# EAGLE design mbc_92_24_07_20 (EAGLE 7.6.0)

## Sheet 1 of 2
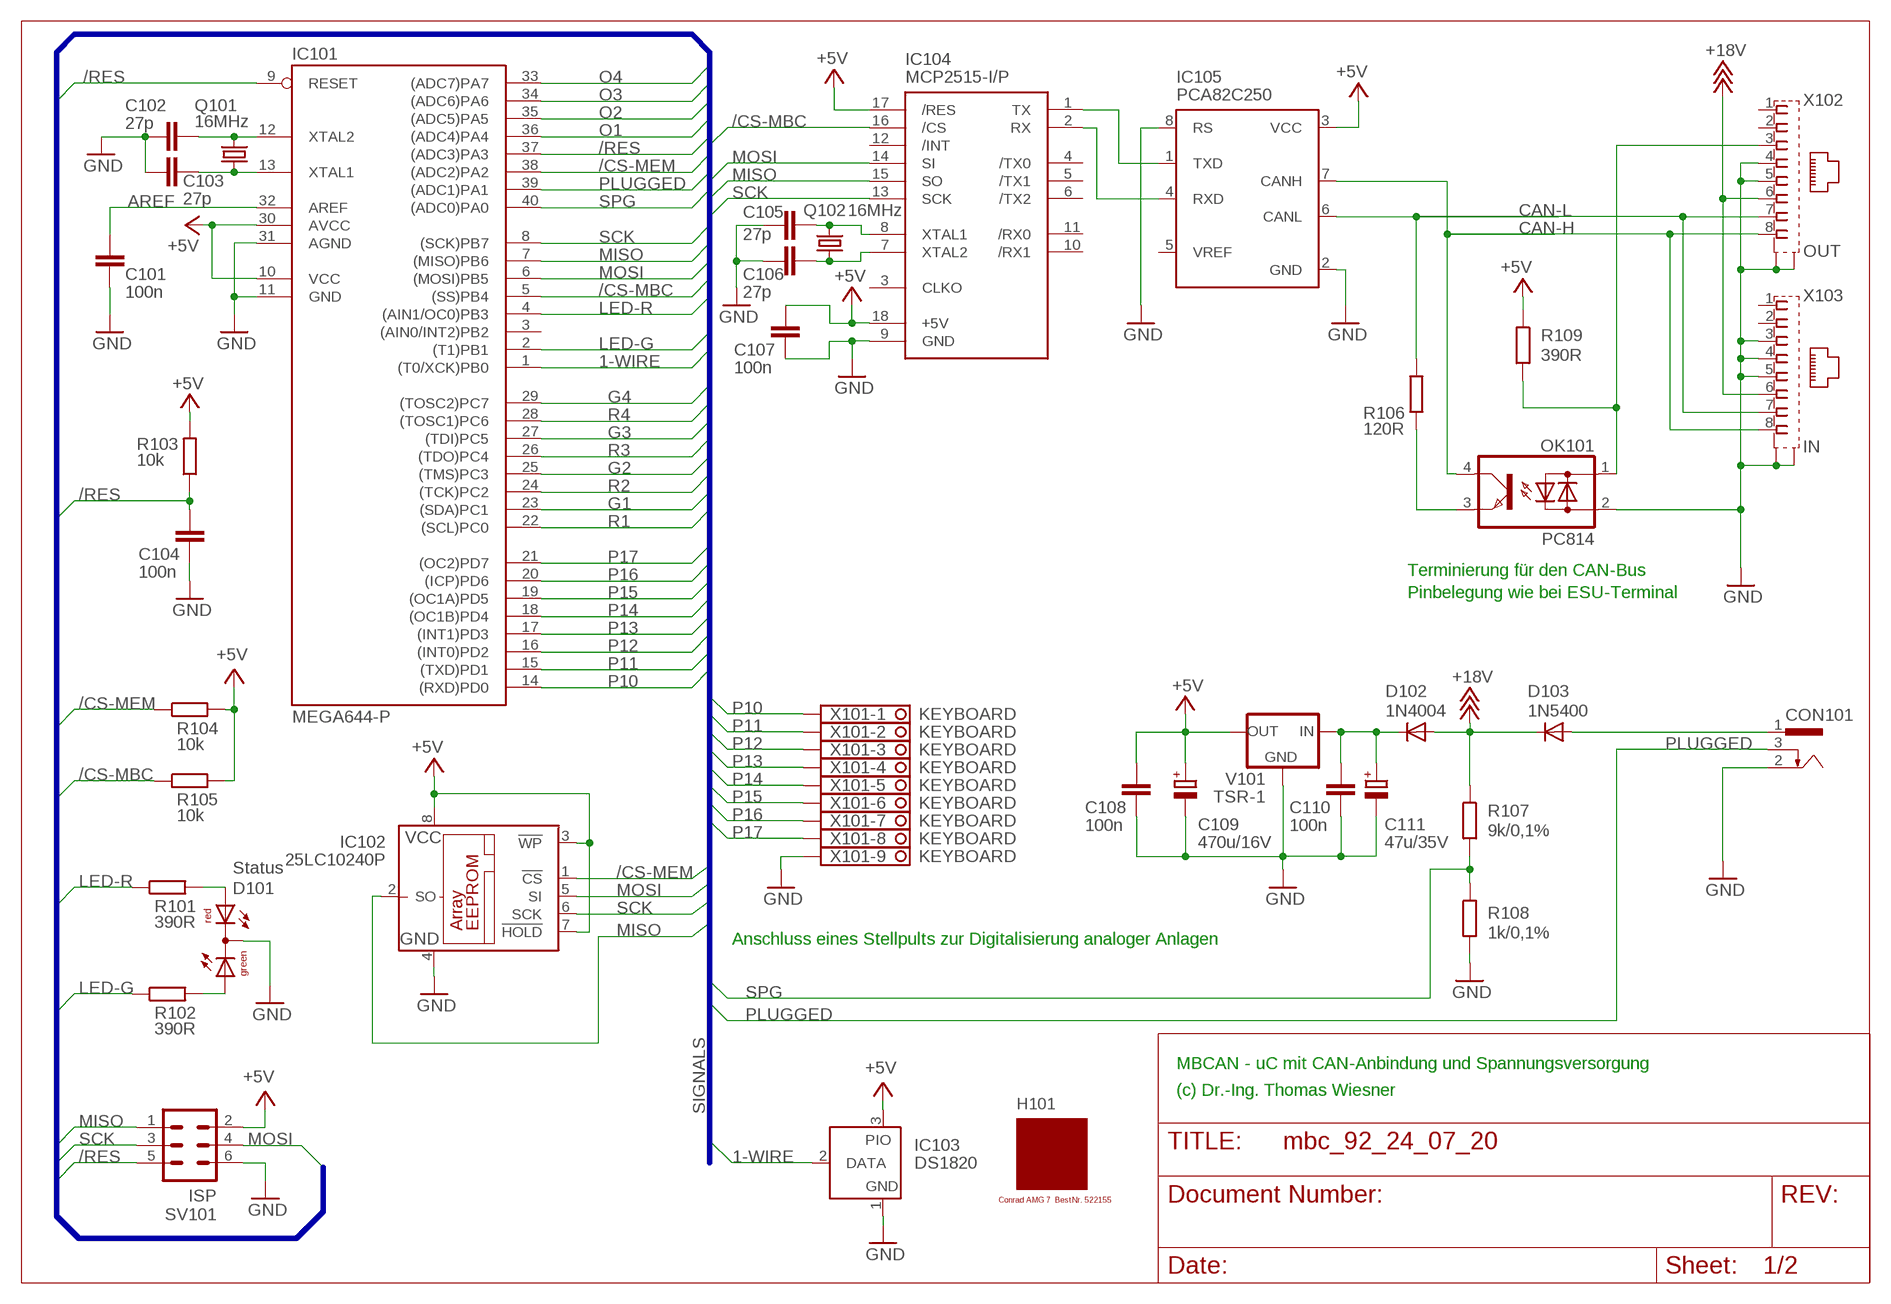
[diagram p0: schematic, sheet 1]

### Parts
C101  100n  C-EU025-025X050  [C025-025X050]
C102  27p  C-EU025-025X050  [C025-025X050]
C103  27p  C-EU025-025X050  [C025-025X050]
C104  100n  C-EU025-025X050  [C025-025X050]
C105  27p  C-EU025-025X050  [C025-025X050]
C106  27p  C-EU025-025X050  [C025-025X050]
C107  100n  C-EU025-025X050  [C025-025X050]
C108  100n  C-EU025-025X050  [C025-025X050]
C109  470u/16V  CPOL-EUE3.5-8  [E3,5-8]
C110  100n  C-EU025-025X050  [C025-025X050]
C111  47u/35V  CPOL-EUE2.5-7  [E2,5-7]
CON101  POWER-JACK  [POWER-JACK]
D101  Status  DUOLED5MM  [DUOLED5MM]
D102  1N4004  [DO41-10]
D103  1N5400  [DO201-15]
H101  MODULGEHÄUSE-AMG-7  [MODULGEHÄUSE-1]
IC101  MEGA644-P  MEGA323-P  [DIL40]
IC102  25LC10240P  25LC040P  [DIL8]
IC103  DS1820  DS2405  [TO92-]
IC104  MCP2515-I/P  MCP2510-I/P  [DIL18]
IC105  PCA82C250  [DIL08]
OK101  PC814  [DIL04]
Q101  16MHz  CRYSTALHC49U70  [HC49U70]
Q102  16MHz  CRYSTALHC49U70  [HC49U70]
R101  390R  R-EU_0207/10  [0207/10]
R102  390R  R-EU_0207/10  [0207/10]
R103  10k  R-EU_0207/10  [0207/10]
R104  10k  R-EU_0207/10  [0207/10]
R105  10k  R-EU_0207/10  [0207/10]
R106  120R  R-EU_0207/10  [0207/10]
R107  9k/0,1%  R-EU_0207/10  [0207/10]
R108  1k/0,1%  R-EU_0207/10  [0207/10]
R109  390R  R-EU_0207/10  [0207/10]
SV101  ISP  ML6  [ML6]
V101  TSR-1  [TRACO-TSR-1]
X101  KEYBOARD  1751316  [1751316]
X102  OUT  0446200002  [0446200002]
X103  IN  0446200002  [0446200002]

### Nets
1-WIRE: IC101.1((T0/XCK)PB0) IC103.2(DATA)
+5V: C107.1 C108.1 C109.+ IC101.10(VCC) IC101.30(AVCC) IC102.3(!WP) IC102.7(!HOLD) IC102.8(VCC) IC103.3(PIO) IC104.17(/RES) IC104.18(+5V) IC105.3(VCC) R103.2 R104.2 R105.2 R109.1 SV101.2 V101.OUT ; also sheet 2
+18V: D102.A D103.C R107.1 X102.6 X103.6
/CS-MBC: IC101.5((SS)PB4) IC104.16(/CS) R105.1
/CS-MEM: IC101.38((ADC2)PA2) IC102.1(!CS) R104.1
/RES: C104.1 IC101.9(RESET) IC101.37((ADC3)PA3) R103.1 SV101.5
AREF: C101.1 IC101.32(AREF)
CAN-H: IC105.7(CANH) OK101.4(C) X102.8 X103.8
CAN-L: IC105.6(CANL) R106.2 X102.7 X103.7
G1: IC101.23((SDA)PC1) ; also sheet 2
G2: IC101.25((TMS)PC3) ; also sheet 2
G3: IC101.27((TDI)PC5) ; also sheet 2
G4: IC101.29((TOSC2)PC7) ; also sheet 2
GND: C101.2 C102.1 C103.1 C104.2 C105.1 C106.1 C107.2 C108.2 C109.- C110.2 C111.- CON101.2 D101.K(C) IC101.11(GND) IC101.31(AGND) IC102.4(GND) IC103.1(GND) IC104.9(GND) IC105.2(GND) IC105.8(RS) OK101.2(AC2) R108.2 SV101.6 V101.GND X101.9 X102.4 X102.5 X102.S@1(S1) X102.S@2(S2) X103.3 X103.4 X103.5 X103.S@1(S1) X103.S@2(S2) ; also sheet 2
LED-G: IC101.2((T1)PB1) R102.1
LED-R: IC101.4((AIN1/OC0)PB3) R101.1
MISO: IC101.7((MISO)PB6) IC102.2(SO) IC104.15(SO) SV101.1
MOSI: IC101.6((MOSI)PB5) IC102.5(SI) IC104.14(SI) SV101.4
N$1: IC104.1(TX) IC105.1(TXD)
N$2: IC104.2(RX) IC105.4(RXD)
N$3: OK101.3(E) R106.1
N$4: OK101.1(AC1) R109.2 X102.3
N$6: C110.1 C111.+ D102.C V101.IN
N$9: D101.AR R101.2
N$13: D101.AG R102.2
N$40: C102.2 IC101.12(XTAL2) Q101.2
N$41: C103.2 IC101.13(XTAL1) Q101.1
N$42: C105.2 IC104.8(XTAL1) Q102.2
N$43: C106.2 IC104.7(XTAL2) Q102.1
O1: IC101.36((ADC4)PA4) ; also sheet 2
O2: IC101.35((ADC5)PA5) ; also sheet 2
O3: IC101.34((ADC6)PA6) ; also sheet 2
O4: IC101.33((ADC7)PA7) ; also sheet 2
P10: IC101.14((RXD)PD0) X101.1
P11: IC101.15((TXD)PD1) X101.2
P12: IC101.16((INT0)PD2) X101.3
P13: IC101.17((INT1)PD3) X101.4
P14: IC101.18((OC1B)PD4) X101.5
P15: IC101.19((OC1A)PD5) X101.6
P16: IC101.20((ICP)PD6) X101.7
P17: IC101.21((OC2)PD7) X101.8
PLUGGED: CON101.3 IC101.39((ADC1)PA1)
R1: IC101.22((SCL)PC0) ; also sheet 2
R2: IC101.24((TCK)PC2) ; also sheet 2
R3: IC101.26((TDO)PC4) ; also sheet 2
R4: IC101.28((TOSC1)PC6) ; also sheet 2
SCK: IC101.8((SCK)PB7) IC102.6(SCK) IC104.13(SCK) SV101.3
SPG: IC101.40((ADC0)PA0) R107.2 R108.1
V-NETZTEIL1: CON101.1 D103.A
Unconnected: IC101.3((AIN0/INT2)PB2) IC104.3(CLKO) IC104.4(/TX0) IC104.5(/TX1) IC104.6(/TX2) IC104.10(/RX1) IC104.11(/RX0) IC104.12(/INT) IC105.5(VREF) X102.1 X102.2 X103.1 X103.2

### Buses
SIGNALS

### Notes on the sheet
- Terminierung für den CAN-Bus
- Pinbelegung wie bei ESU-Terminal
- Anschluss eines Stellpults zur Digitalisierung analoger Anlagen
- MBCAN - uC mit CAN-Anbindung und Spannungsversorgung
- (c) Dr.-Ing. Thomas Wiesner

## Sheet 2 of 2
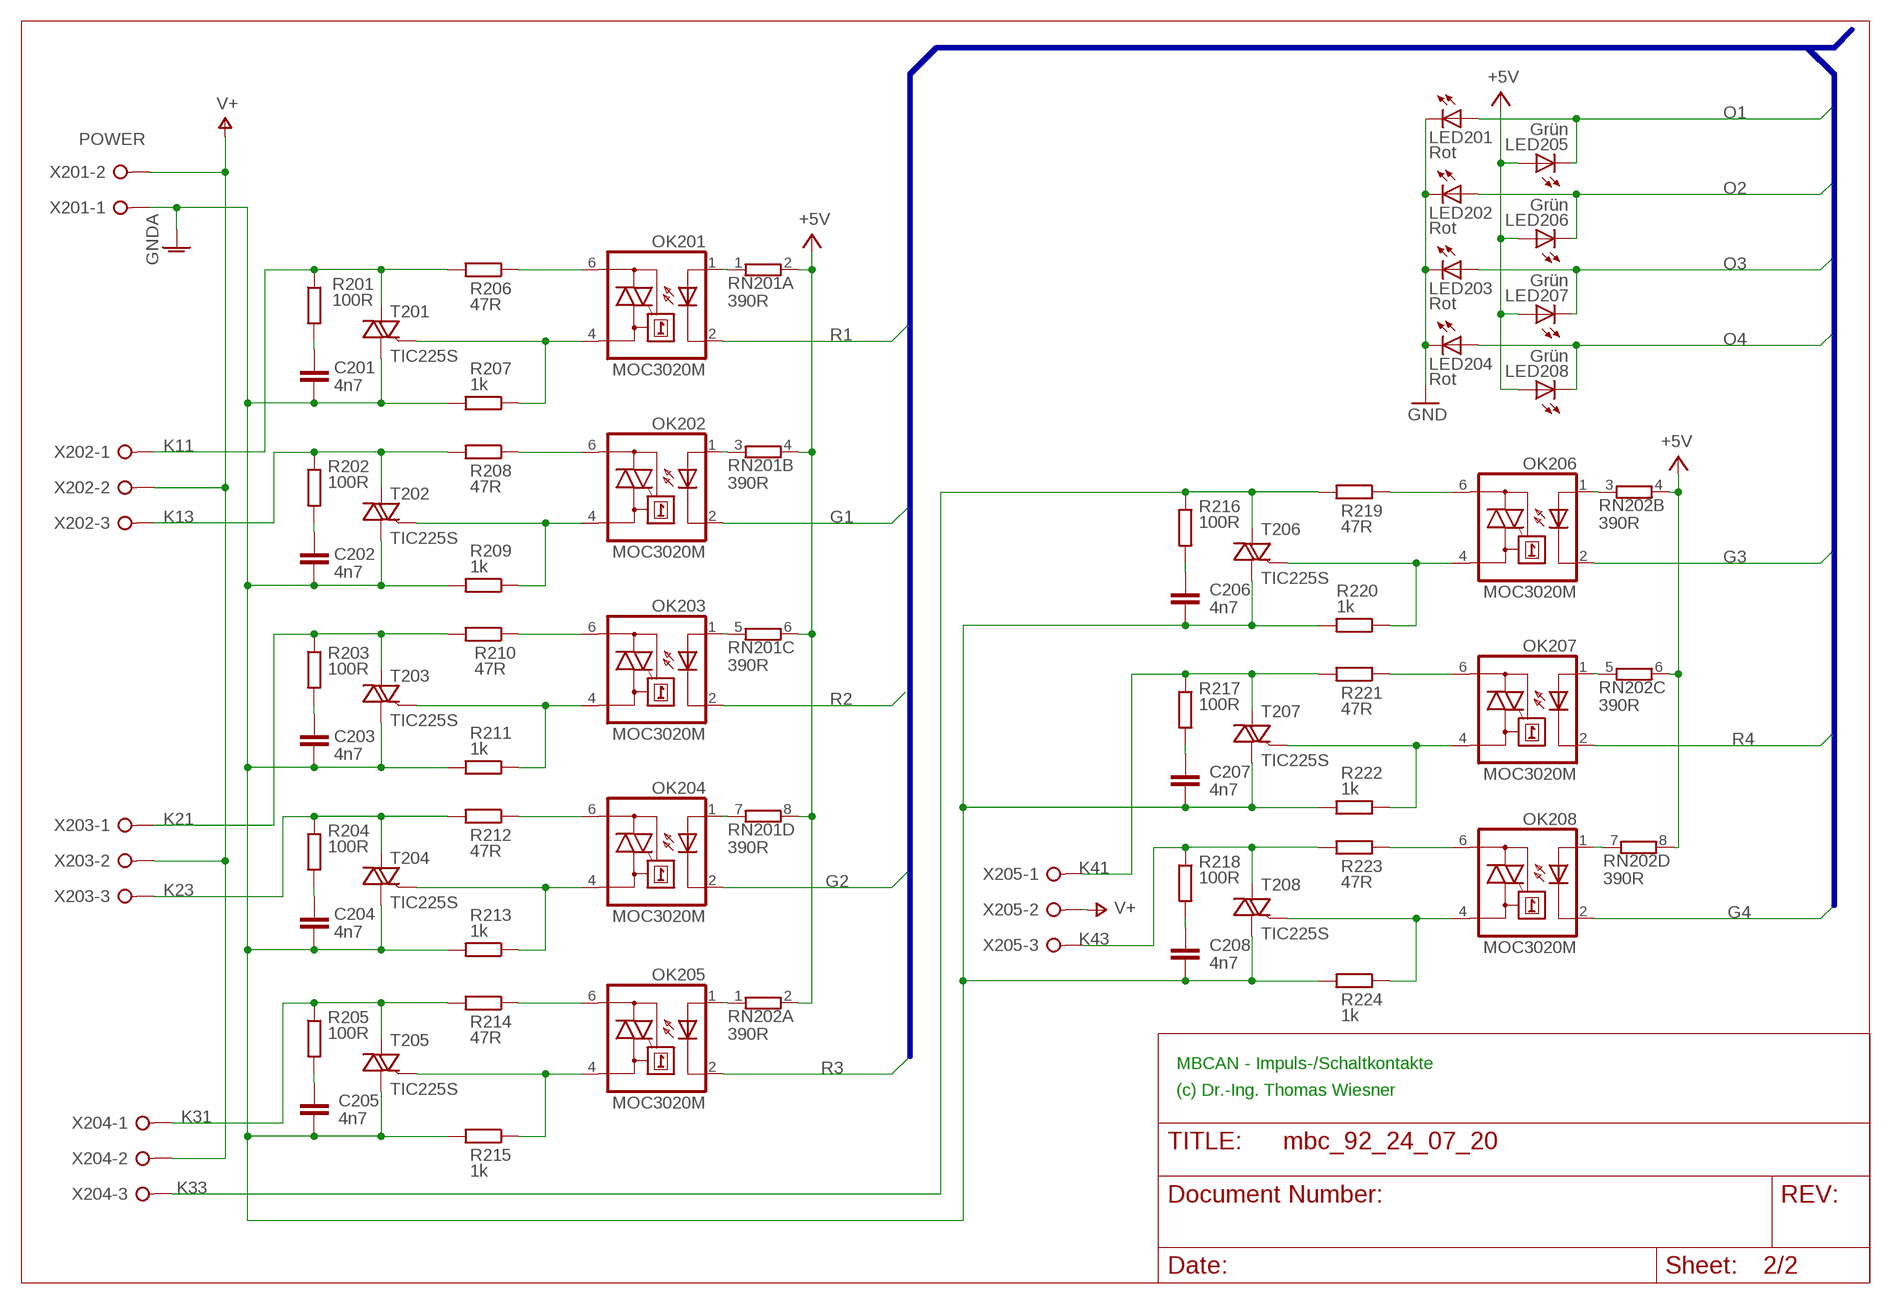
[diagram p1: schematic, sheet 2]

### Parts
C201  4n7  C-EU025-025X050  [C025-025X050]
C202  4n7  C-EU025-025X050  [C025-025X050]
C203  4n7  C-EU025-025X050  [C025-025X050]
C204  4n7  C-EU025-025X050  [C025-025X050]
C205  4n7  C-EU025-025X050  [C025-025X050]
C206  4n7  C-EU025-025X050  [C025-025X050]
C207  4n7  C-EU025-025X050  [C025-025X050]
C208  4n7  C-EU025-025X050  [C025-025X050]
LED201  Rot  LED3MM  [LED3MM]
LED202  Rot  LED3MM  [LED3MM]
LED203  Rot  LED3MM  [LED3MM]
LED204  Rot  LED3MM  [LED3MM]
LED205  Grün  LED3MM  [LED3MM]
LED206  Grün  LED3MM  [LED3MM]
LED207  Grün  LED3MM  [LED3MM]
LED208  Grün  LED3MM  [LED3MM]
OK201  MOC3020M  [DIL06]
OK202  MOC3020M  [DIL06]
OK203  MOC3020M  [DIL06]
OK204  MOC3020M  [DIL06]
OK205  MOC3020M  [DIL06]
OK206  MOC3020M  [DIL06]
OK207  MOC3020M  [DIL06]
OK208  MOC3020M  [DIL06]
R201  100R  R-EU_0207/10  [0207/10]
R202  100R  R-EU_0207/10  [0207/10]
R203  100R  R-EU_0207/10  [0207/10]
R204  100R  R-EU_0207/10  [0207/10]
R205  100R  R-EU_0207/10  [0207/10]
R206  47R  R-EU_0207/10  [0207/10]
R207  1k  R-EU_0207/10  [0207/10]
R208  47R  R-EU_0207/10  [0207/10]
R209  1k  R-EU_0207/10  [0207/10]
R210  47R  R-EU_0207/10  [0207/10]
R211  1k  R-EU_0207/10  [0207/10]
R212  47R  R-EU_0207/10  [0207/10]
R213  1k  R-EU_0207/10  [0207/10]
R214  47R  R-EU_0207/10  [0207/10]
R215  1k  R-EU_0207/10  [0207/10]
R216  100R  R-EU_0207/10  [0207/10]
R217  100R  R-EU_0207/10  [0207/10]
R218  100R  R-EU_0207/10  [0207/10]
R219  47R  R-EU_0207/10  [0207/10]
R220  1k  R-EU_0207/10  [0207/10]
R221  47R  R-EU_0207/10  [0207/10]
R222  1k  R-EU_0207/10  [0207/10]
R223  47R  R-EU_0207/10  [0207/10]
R224  1k  R-EU_0207/10  [0207/10]
RN201  390R  E4R  [SIL8]
RN202  390R  E4R  [SIL8]
T201  TIC225S  [TO220DS]
T202  TIC225S  [TO220DS]
T203  TIC225S  [TO220DS]
T204  TIC225S  [TO220DS]
T205  TIC225S  [TO220DS]
T206  TIC225S  [TO220DS]
T207  TIC225S  [TO220DS]
T208  TIC225S  [TO220DS]
X201  POWER  W237-02P  [W237-132]
X202  W237-03P  [W237-133]
X203  W237-03P  [W237-133]
X204  W237-03P  [W237-133]
X205  W237-03P  [W237-133]

### Nets
+5V: LED205.A LED206.A LED207.A LED208.A RN201.2 RN201.4 RN201.6 RN201.8 RN202.2 RN202.4 RN202.6 RN202.8 ; also sheet 1
G1: OK202.2(C) ; also sheet 1
G2: OK204.2(C) ; also sheet 1
G3: OK206.2(C) ; also sheet 1
G4: OK208.2(C) ; also sheet 1
GND: LED201.K(C) LED202.K(C) LED203.K(C) LED204.K(C) ; also sheet 1
GNDA: C201.2 C202.2 C203.2 C204.2 C205.2 C206.2 C207.2 C208.2 R207.2 R209.2 R211.2 R213.2 R215.2 R220.2 R222.2 R224.2 T201.A1 T202.A1 T203.A1 T204.A1 T205.A1 T206.A1 T207.A1 T208.A1 X201.1
K11: R201.1 R206.2 T201.A2 X202.1
K13: R202.1 R208.2 T202.A2 X202.3
K21: R203.1 R210.2 T203.A2 X203.1
K23: R204.1 R212.2 T204.A2 X203.3
K31: R205.1 R214.2 T205.A2 X204.1
K33: R216.1 R219.2 T206.A2 X204.3
K41: R217.1 R221.2 T207.A2 X205.1
K43: R218.1 R223.2 T208.A2 X205.3
N$5: OK206.1(A) RN202.3
N$7: OK201.1(A) RN201.1
N$8: OK206.4(A1) R220.1 T206.G
N$10: OK201.4(A1) R207.1 T201.G
N$11: OK201.6(A2) R206.1
N$12: OK202.1(A) RN201.3
N$14: OK206.6(A2) R219.1
N$15: C201.1 R201.2
N$16: C206.1 R216.2
N$17: OK202.4(A1) R209.1 T202.G
N$18: OK202.6(A2) R208.1
N$19: OK207.1(A) RN202.5
N$20: C202.1 R202.2
N$21: OK203.1(A) RN201.5
N$22: OK207.4(A1) R222.1 T207.G
N$23: OK203.4(A1) R211.1 T203.G
N$24: OK203.6(A2) R210.1
N$25: OK207.6(A2) R221.1
N$26: C203.1 R203.2
N$27: OK204.1(A) RN201.7
N$28: C207.1 R217.2
N$29: OK204.4(A1) R213.1 T204.G
N$30: OK204.6(A2) R212.1
N$31: OK208.1(A) RN202.7
N$32: C204.1 R204.2
N$33: OK205.1(A) RN202.1
N$34: OK208.4(A1) R224.1 T208.G
N$35: OK205.4(A1) R215.1 T205.G
N$36: OK205.6(A2) R214.1
N$37: OK208.6(A2) R223.1
N$38: C205.1 R205.2
N$39: C208.1 R218.2
O1: LED201.A LED205.K(C) ; also sheet 1
O2: LED202.A LED206.K(C) ; also sheet 1
O3: LED203.A LED207.K(C) ; also sheet 1
O4: LED204.A LED208.K(C) ; also sheet 1
R1: OK201.2(C) ; also sheet 1
R2: OK203.2(C) ; also sheet 1
R3: OK205.2(C) ; also sheet 1
R4: OK207.2(C) ; also sheet 1
V+: X201.2 X202.2 X203.2 X204.2 X205.2

### Buses
B$1

### Notes on the sheet
- MBCAN - Impuls-/Schaltkontakte
- (c) Dr.-Ing. Thomas Wiesner

## Library data of the parts
C101-C108 C110 = rcl:C-EU: CAPACITOR, European symbol
C109 C111 = rcl:CPOL-EU: POLARIZED CAPACITOR, European symbol
C201-C208 = resistor:C-EU: CAPACITOR, European symbol
CON101 = mbc:POWER-JACK: Power-Stecker für 2,5 mm Hohlbuchse
D101 = led:DUOLED5MM: DUO LED 2 colors, 5 mm, round
D102 = diode:1N4004: DIODE general purpose rectifier, 1 A
D103 = diode:1N5400: DIODE standard rectifier, 3 A, 50 V (Motorola)
H101 = mbc:MODULGEHÄUSE-AMG-7: Gehäuse Conrad AMG 7 BestNr. 522155
IC101 = atmel:MEGA323-P: MICROCONTROLLER 32 Kbytes FLASH 2 Kbytes SRAM 1 Kbytes EEPROM USART 8-channel 10 bit ADC Source: avr.lbr; OC_FARNELL: unknown; OC_NEWARK: unknown
IC102 = microchip:25*: Serial EEPROM 4K/ 8K , SPI bus; MF: MICROCHIP; MPN: 25LC040/P; OC_FARNELL: 9758100; OC_NEWARK: 96K4091
IC103 = maxim:DS2405: Addressable Switch DALLAS Semiconductor; MF: DALLAS SEMICONDUCTOR; MPN: DS2405; OC_FARNELL: 1188025; OC_NEWARK: 06F4645
IC104 = mbc:MCP2510: BASIC-CAN 2.0a Controller Stand-alone CAN controller von Microchip
IC105 = micro-philips:PCA82C250: CAN CONTROLLER INTERFACE; OC_FARNELL: 3692358; OC_NEWARK: unknown
LED201-LED208 = led:LED: LED OSRAM: - CHIPLED LG R971, LG N971, LY N971, LG Q971, LY Q971, LO R971, LY R971 LH N974, LH R974 LS Q976, LO Q976, LY Q976 LO Q996 - Hyper CHIPLED LW Q18S LB Q993, LB Q99A, LB R99A - SideLED LS A670, LO A670, LY A670, LG A670, LP A670 LB A673, LV A673, LT A673, LW A673 LH A674 LY A675 LS A676, LA A676, LO A676, LY A676, LW A676 LS A679, LY A679, LG A679 - Hyper Micro SIDELED® LS Y876, LA Y876, LO Y876, LY Y876 LT Y87S - SmartLED LW L88C, LW L88S LB L89C, LB L89S, LG L890 LS L89K, LO L89K, LY L89K LS L896, LA L896, LO L896, LY L896 - TOPLED LS T670, LO T670, LY T670, LG T670, LP T670 LSG T670, LSP T670, LSY T670, LOP T670, LYG T670 LG T671, LOG T671, LSG T671 LB T673, LV T673, LT T673, LW T673 LH T674 LS T676, LA T676, LO T676, LY T676, LB T676, LH T676, LSB T676, LW T676 LB T67C, LV T67C, LT T67C, LS T67K, LO T67K, LY T67K, LW E67C LS E67B, LA E67B, LO E67B, LY E67B, LB E67C, LV E67C, LT E67C LW T67C LS T679, LY T679, LG T679 LS T770, LO T770, LY T770, LG T770, LP T770 LB T773, LV T773, LT T773, LW T773 LH T774 LS E675, LA E675, LY E675, LS T675 LS T776, LA T776, LO T776, LY T776, LB T776 LHGB T686 LT T68C, LB T68C - Hyper Mini TOPLED® LB M676 - Mini TOPLED Santana® LG M470 LS M47K, LO M47K, LY M47K Source: http://www.osram.convergy.de LUXEON: - LUMILED® LXK2-PW12-R00, LXK2-PW12-S00, LXK2-PW14-U00, LXK2-PW14-V00 LXK2-PM12-R00, LXK2-PM12-S00, LXK2-PM14-U00 LXK2-PE12-Q00, LXK2-PE12-R00, LXK2-PE12-S00, LXK2-PE14-T00, LXK2-PE14-U00 LXK2-PB12-K00, LXK2-PB12-L00, LXK2-PB12-M00, LXK2-PB14-N00, LXK2-PB14-P00, LXK2-PB14-Q00 LXK2-PR12-L00, LXK2-PR12-M00, LXK2-PR14-Q00, LXK2-PR14-R00 LXK2-PD12-Q00, LXK2-PD12-R00, LXK2-PD12-S00 LXK2-PH12-R00, LXK2-PH12-S00 LXK2-PL12-P00, LXK2-PL12-Q00, LXK2-PL12-R00 Source: www.luxeon.com KINGBRIGHT: KA-3528ASYC Source: www.kingbright.com
OK101 = optocoupler:PC814: SHARP OPTO COUPLER; OC_FARNELL: 9707662; OC_NEWARK: unknown
OK201-OK208 = optocoupler:MOC30*M: RANDOM-PHASE OPTOISOLATORS TRIAC DRIVER OUTPUT Source: http://www.fairchildsemi.com MOC3020-M.pdf; MF: FAIRCHILD SEMICONDUCTOR; MPN: MOC3020-M; OC_FARNELL: 1505425; OC_NEWARK: 72K8895
Q101 Q102 = crystal:CRYSTAL: CRYSTAL; OC_FARNELL: unknown; OC_NEWARK: unknown
R101-R109 R201-R224 = resistor:R-EU_: RESISTOR, European symbol
RN201 RN202 = resistor-sil:E4R: SIL RESISTOR; OC_FARNELL: unknown; OC_NEWARK: unknown
SV101 = con-ml:ML6: HARTING; OC_FARNELL: unknown; OC_NEWARK: unknown
T201-T208 = triac:TIC225S: TRIAC
V101 = mbc:TSR-1: Spannungsregler Hersteller: TRACO Typ: TSR-1 5V: TSR 1-2450 Spg: 5V Strom: 1A Reichelt TSR 1-2450
X101 = con-phoenix-350:1751316: MKDS 1/ 9-3,5 Printklemme Nennstrom: 10 A Bemessungsspannung: 160 V Raster: 3,5 mm Polzahl: 9 Montageart: Löten Anschlussart: Schraubanschluss Anschlussrichtung vom Leiter zur Platine: 0° Source: http://eshop.phoenixcontact.com .. 1751316.pdf; OC_FARNELL: unknown; OC_NEWARK: unknown
X102 X103 = mbc:0446200002: RJ-45 INVERTED MODULAR JACK ASSEMBLY WITH RJ-11 KEEPOUT FEATURE Source: Data sheet <http://www.farnell.com/datasheets/73207.pdf> MOLEX 0446200002 BUCHSE, RJ45, GESCHIRMT Source: Farnell <http://de.farnell.com/molex/0446200002/buchse-rj45-geschirmt/dp/9251910?ost=9251910>; MF: MOLEX; MPN: 0446200002; OC_FARNELL: 9251910
X201 = con-wago-508:W237-02P: WAGO SREW CLAMP; OC_FARNELL: unknown; OC_NEWARK: unknown
X202-X205 = con-wago-508:W237-03P: WAGO SREW CLAMP; OC_FARNELL: unknown; OC_NEWARK: unknown

## Board
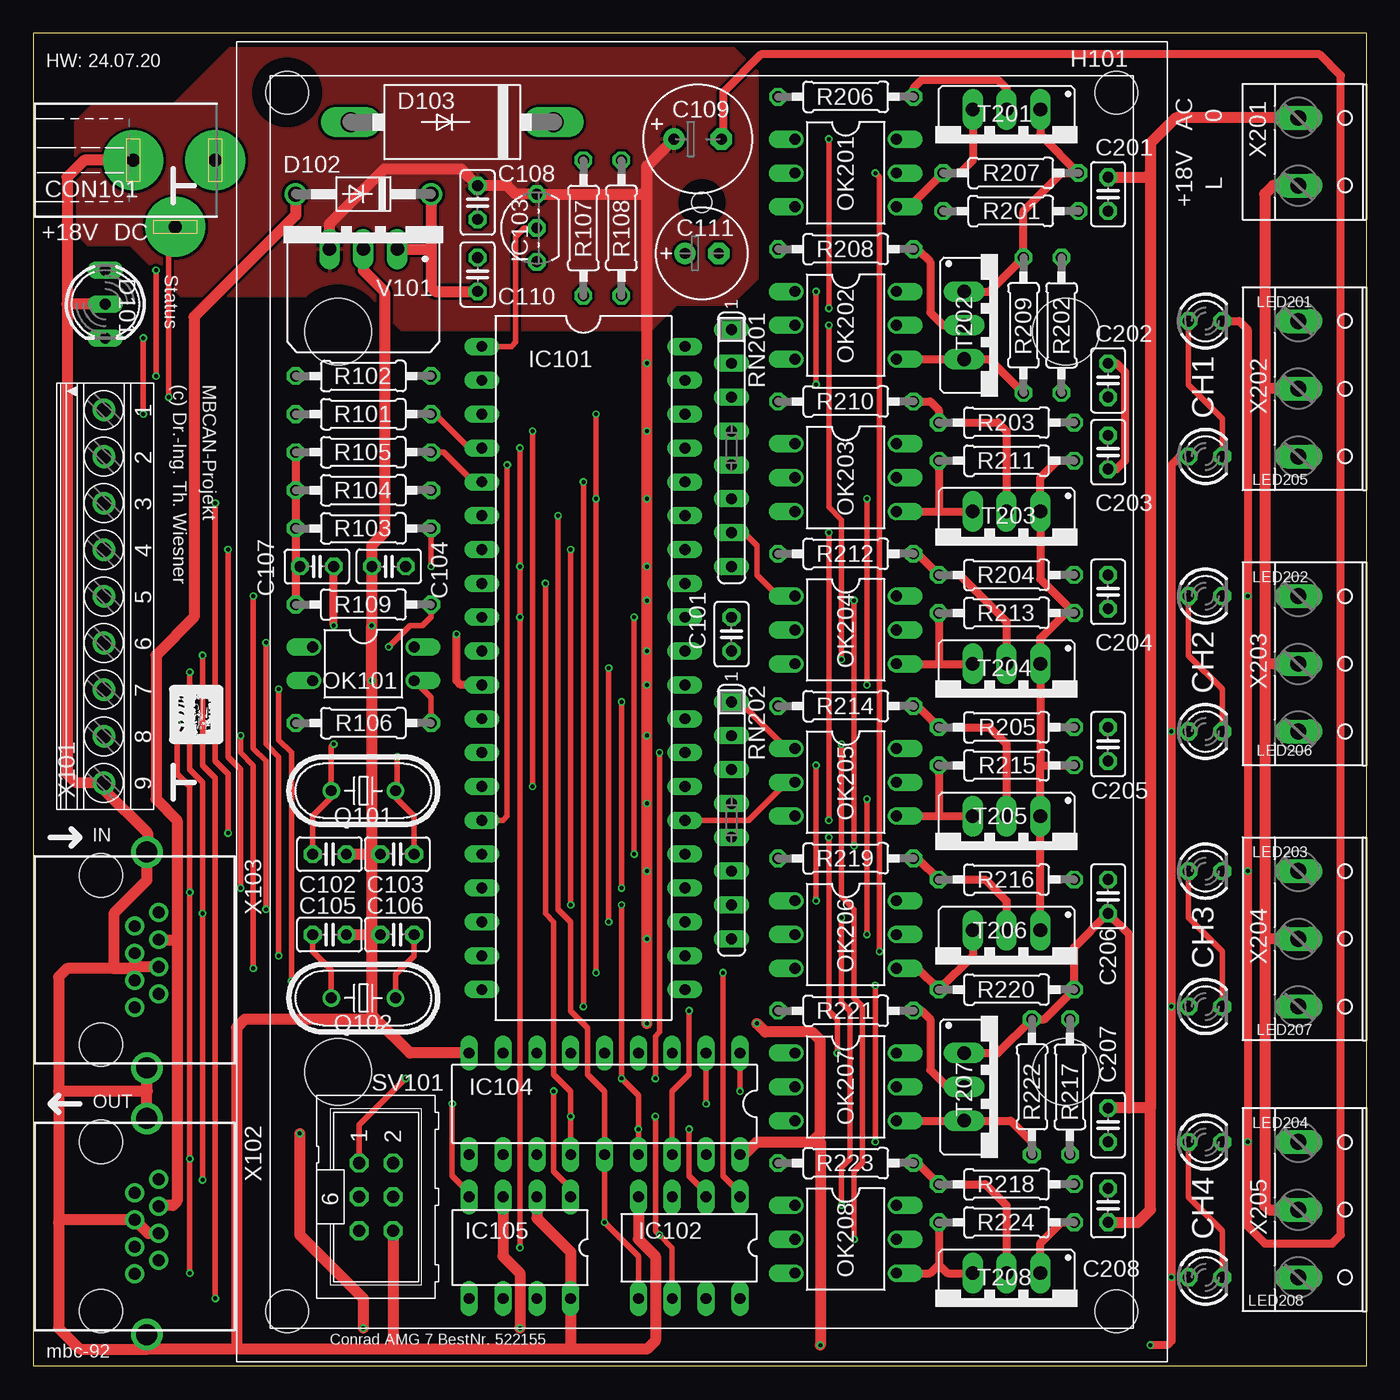
[diagram p2: board, top side]
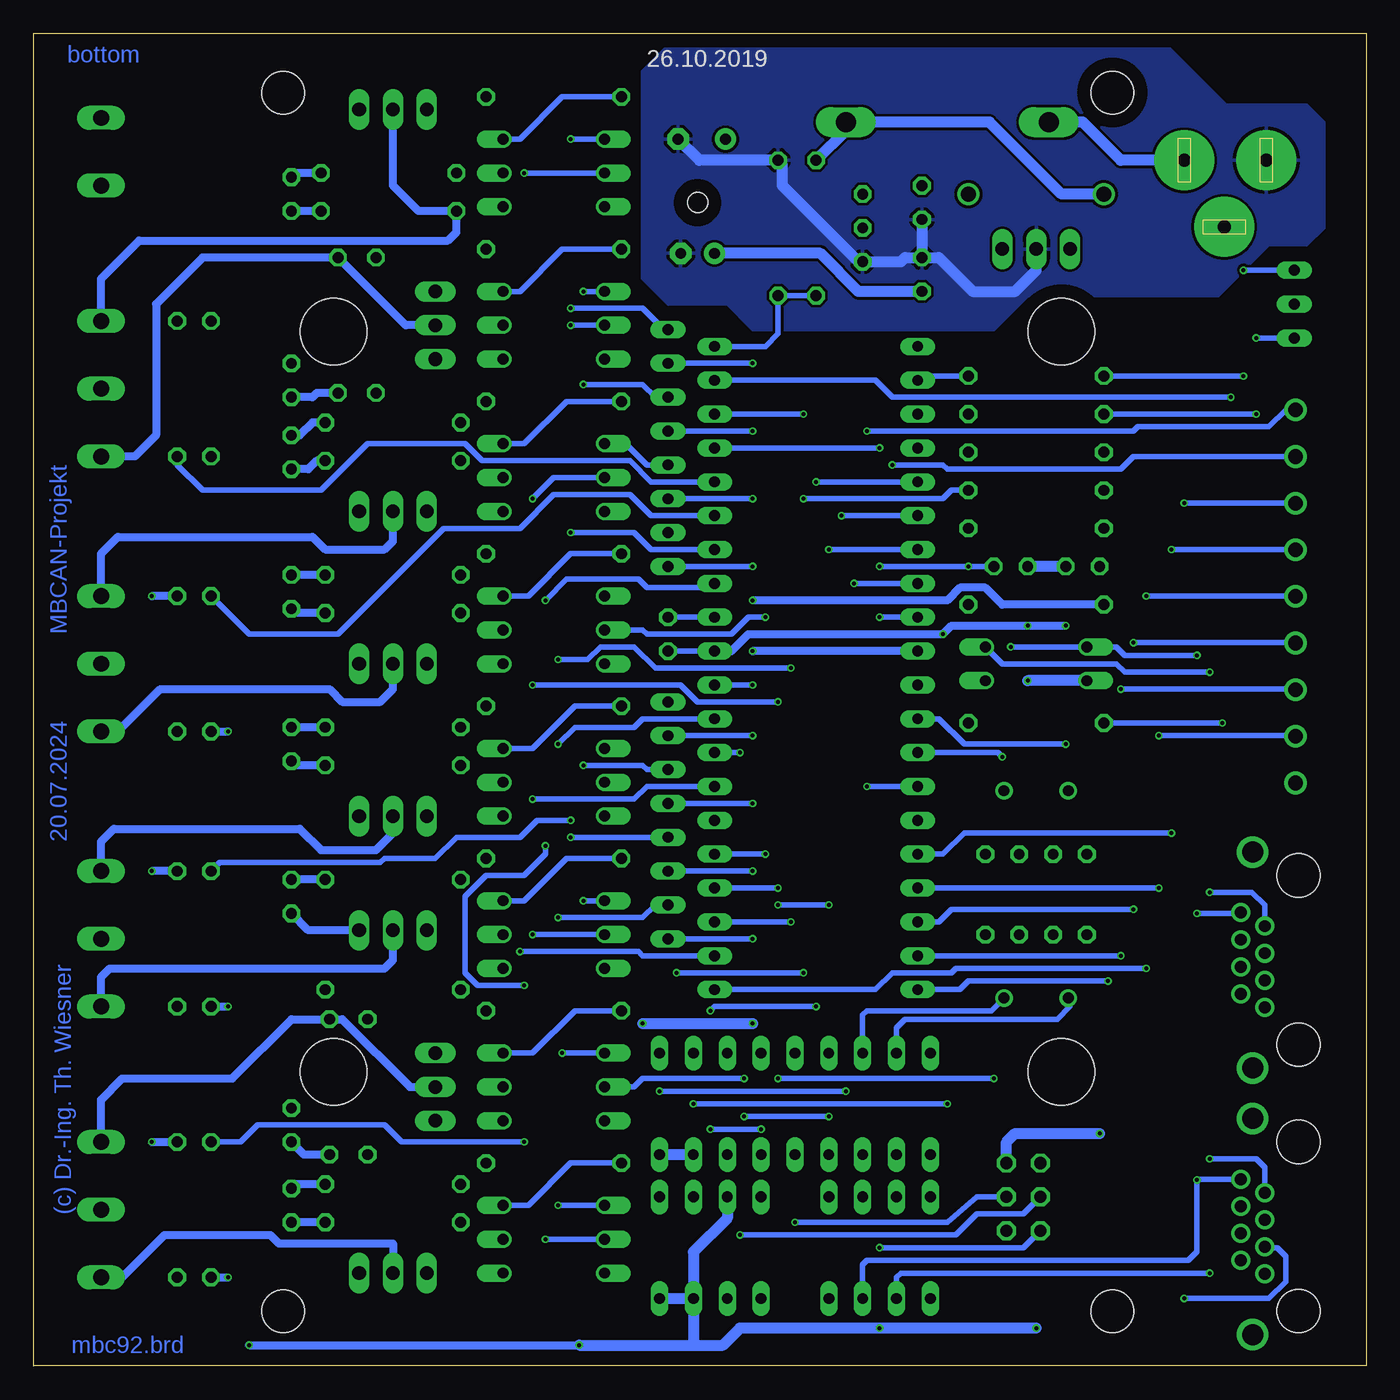
[diagram p3: board, bottom side, seen from below]

Size 100.01 x 100.01 mm. Coordinates in mm from the lower left corner, seen from the top.
Outline: 100,0.02 0,0.02 0,100.01 100,100.01
Outline: 100.01,100.01 100.01,0
Copper layers (1*16): Top 0.035mm / dielectric 1.5mm / Bottom 0.035mm
Design rules "default *": minimum track width 10mil, minimum drill 0.3mm, track to track 8mil, track to pad 8mil, pad to pad 8mil, via to via 8mil, smd to smd 8mil, copper to edge 40mil, drill to drill 8mil, minimum pad ring 10mil, minimum via ring 0.125mm, stop-mask expansion 4mil, vias tented up to drill 0mil, thermal gap 10mil

### Footprints (pad centres in the part's own frame; a part is rotated, then mirrored left to right if it is on the bottom)
C025-025X050 = drill 0.813 octagon: 1 -1.27,0; 2 1.27,0
E3,5-8 = drill 0.813 pad 1.6: + -1.778,0 | drill 0.813 pad 1.6 octagon: - 1.778,0
E2,5-7 = drill 0.813 pad 1.6: + -1.27,0 | drill 0.813 pad 1.6 octagon: - 1.27,0
POWER-JACK = drill 1 pad 4.5: 1 0,6.03; 2 0,-0.12; 3 5,3.03
DUOLED5MM = drill 0.813 long: AG -2.54,0; AR 2.54,0; K 0,0
DO41-10 = drill 1.118: A 5.08,0; C -5.08,0
DO201-15 = drill 1.499 long: A 7.62,0; C -7.62,0
MODULGEHÄUSE-1 = hole 3.2: -45.72,-31.115; -45.72,31.115; 45.72,31.115; 45.72,-31.115 | hole 5: -27.781,-27.305; 27.781,-27.305; -27.781,27.305; 27.781,27.305 | hole 1.5: -37.465,0
DIL40 = drill 0.813 long: 1 -24.13,-7.62; 2 -21.59,-7.62; 3 -19.05,-7.62; 4 -16.51,-7.62; 5 -13.97,-7.62; 6 -11.43,-7.62; 7 -8.89,-7.62; 8 -6.35,-7.62; 9 -3.81,-7.62; 10 -1.27,-7.62; 11 1.27,-7.62; 12 3.81,-7.62; 13 6.35,-7.62; 14 8.89,-7.62; 15 11.43,-7.62; 16 13.97,-7.62; 17 16.51,-7.62; 18 19.05,-7.62; 19 21.59,-7.62; 20 24.13,-7.62; 21 24.13,7.62; 22 21.59,7.62; 23 19.05,7.62; 24 16.51,7.62; 25 13.97,7.62; 26 11.43,7.62; 27 8.89,7.62; 28 6.35,7.62; 29 3.81,7.62; 30 1.27,7.62; 31 -1.27,7.62; 32 -3.81,7.62; 33 -6.35,7.62; 34 -8.89,7.62; 35 -11.43,7.62; 36 -13.97,7.62; 37 -16.51,7.62; 38 -19.05,7.62; 39 -21.59,7.62; 40 -24.13,7.62
DIL8 = drill 0.813 long: 1 -3.81,-3.81; 2 -1.27,-3.81; 3 1.27,-3.81; 4 3.81,-3.81; 5 3.81,3.81; 6 1.27,3.81; 7 -1.27,3.81; 8 -3.81,3.81
TO92- = drill 0.813 octagon: 1 -2.54,0; 2 0,0; 3 2.54,0
DIL18 = drill 0.813 long: 1 -10.16,-3.81; 2 -7.62,-3.81; 3 -5.08,-3.81; 4 -2.54,-3.81 | drill 0.8 long: 5 0,-3.81; 6 2.54,-3.81; 7 5.08,-3.81; 8 7.62,-3.81; 9 10.16,-3.81; 10 10.16,3.81; 11 7.62,3.81; 12 5.08,3.81; 13 2.54,3.81; 14 0,3.81; 15 -2.54,3.81; 16 -5.08,3.81; 17 -7.62,3.81; 18 -10.16,3.81
DIL08 = drill 0.813 long: 1 -3.81,-3.81; 2 -1.27,-3.81; 3 1.27,-3.81; 4 3.81,-3.81; 5 3.81,3.81; 6 1.27,3.81; 7 -1.27,3.81; 8 -3.81,3.81
LED3MM = drill 0.813 octagon: A -1.27,0; K 1.27,0
DIL04 = drill 0.813 offset: 1 -1.27,-3.81; 2 1.27,-3.81; 3 1.27,3.81; 4 -1.27,3.81
DIL06 = drill 0.813 offset: 1 -2.54,-3.81; 2 0,-3.81; 3 2.54,-3.81; 4 2.54,3.81; 5 0,3.81; 6 -2.54,3.81
HC49U70 = drill 0.813: 1 -2.413,0; 2 2.413,0
0207/10 = drill 0.813 octagon: 1 -5.08,0; 2 5.08,0
SIL8 = drill 0.813 long: 1 -8.89,0; 2 -6.35,0; 3 -3.81,0; 4 -1.27,0; 5 1.27,0; 6 3.81,0; 7 6.35,0; 8 8.89,0
ML6 = drill 0.914 octagon: 1 -2.54,-1.27; 2 -2.54,1.27; 3 0,-1.27; 4 0,1.27; 5 2.54,-1.27; 6 2.54,1.27
TO220DS = drill 1.016 long: A1 -2.54,-2.54; A2 0,-2.54; G 2.54,-2.54
TRACO-TSR-1 = drill 1.016 long: GND 0,2.54; IN -2.54,2.54; OUT 2.54,2.54
1751316 = drill 1.1 pad 1.7: 1 -13.973,-0.1; 2 -10.473,-0.1; 3 -6.973,-0.1; 4 -3.473,-0.1; 5 0.028,-0.1; 6 3.527,-0.1; 7 7.027,-0.1; 8 10.527,-0.1; 9 14.027,-0.1
0446200002 = drill 0.889 pad 1.422: 1 3.556,2.54; 2 2.54,4.318; 3 1.524,2.54; 4 0.508,4.318; 5 -0.508,2.54; 6 -1.524,4.318; 7 -2.54,2.54; 8 -3.556,4.318 | drill 1.575 pad 2.286: S@1 -8.103,3.429; S@2 8.103,3.429 | hole 3.251: 6.35,0; -6.35,0
W237-132 = drill 1.194 long: 1 -2.54,-0.635; 2 2.54,-0.635
W237-133 = drill 1.194 long: 1 -5.08,-0.635; 2 0,-0.635; 3 5.08,-0.635

### Placement (x,y rotation side)
C101  52.39,54.93 270 top
C102  22.23,38.42 180 top
C103  27.3,38.42 0 top
C104  26.67,60.01 180 top
C105  22.23,32.38 180 top
C106  27.3,32.38 0 top
C107  21.27,60.01 0 top
C108  33.34,87.31 270 top
C109  49.85,92.08 0 top
C110  33.34,81.92 90 top
C111  50.16,83.5 0 top
C201  80.64,87.95 90 top
C202  80.64,73.98 90 top
C203  80.64,68.58 270 top
C204  80.64,58.1 270 top
C205  80.64,46.67 270 top
C206  80.64,35.24 270 top
C207  80.64,18.1 90 top
C208  80.64,12.06 270 top
CON101  7.62,90.49 270 top
D101  5.4,79.69 270 top
D102  24.77,87.95 180 top
D103  31.43,93.34 180 top
H101  50.16,49.85 270 top
IC101  41.27,52.39 270 top
IC102  49.21,8.89 180 top
IC103  37.78,85.41 90 top
IC104  42.86,19.68 180 top
IC105  36.51,8.89 180 top
LED201  87.95,78.42 0 top
LED202  87.95,57.78 0 top
LED203  87.95,37.15 0 top
LED204  87.95,16.83 0 top
LED205  87.95,68.26 0 top
LED206  87.95,47.62 0 top
LED207  87.95,26.99 0 top
LED208  87.95,6.67 0 top
OK101  24.77,52.7 270 top
OK201  60.96,89.53 270 top
OK202  60.96,78.11 270 top
OK203  60.96,66.67 270 top
OK204  60.96,55.24 270 top
OK205  60.96,43.81 270 top
OK206  60.96,32.38 270 top
OK207  60.96,20.95 270 top
OK208  60.96,9.53 270 top
Q101  24.77,43.18 180 top
Q102  24.77,27.62 180 top
R101  24.77,71.44 180 top
R102  24.77,74.3 180 top
R103  24.77,62.87 180 top
R104  24.77,65.72 180 top
R105  24.77,68.58 180 top
R106  24.77,48.26 180 top
R107  41.27,85.41 270 top
R108  44.13,85.41 90 top
R109  24.77,57.15 0 top
R201  73.34,86.68 0 top
R202  77.15,78.11 270 top
R203  73.03,70.8 0 top
R204  73.03,59.37 0 top
R205  73.03,47.94 0 top
R206  60.96,95.25 0 top
R207  73.34,89.53 0 top
R208  60.96,83.82 0 top
R209  74.3,78.11 90 top
R210  60.96,72.39 0 top
R211  73.03,67.94 0 top
R212  60.96,60.96 0 top
R213  73.03,56.52 0 top
R214  60.96,49.53 0 top
R215  73.03,45.09 0 top
R216  73.03,36.51 0 top
R217  77.79,20.95 270 top
R218  73.03,13.65 0 top
R219  60.96,38.1 0 top
R220  73.03,28.26 0 top
R221  60.96,26.67 0 top
R222  74.93,20.95 90 top
R223  60.96,15.24 0 top
R224  73.03,10.79 0 top
RN201  52.39,68.9 270 top
RN202  52.39,40.96 270 top
SV101  25.72,12.7 270 top
T201  73.03,91.76 180 top
T202  72.39,78.11 270 top
T203  73.03,61.59 180 top
T204  73.03,50.16 180 top
T205  73.03,38.73 180 top
T206  73.03,30.16 180 top
T207  72.39,20.95 270 top
T208  73.03,4.45 180 top
V101  24.77,86.36 180 top
X101  5.4,57.78 270 top
X102  5.08,10.48 270 top
X103  5.08,30.48 270 top
X201  95.57,91.12 270 top
X202  95.57,73.34 270 top
X203  95.57,52.7 270 top
X204  95.57,32.07 270 top
X205  95.57,11.75 270 top

### Tracks (layer width: path | path; a pad name or v marks a point on that pad's centre or on a via)
1-WIRE
  Top 0.406: IC103.2 36.83,85.41 36.2,84.77 36.2,76.83 35.88,76.52 IC101.1
+5V  (via drill 0.3)
  Top 0.61: R105.2 R104.2 R103.2 19.68,60.33 C107.1 19.68,59.69 R109.1 | LED205.A 86.04,68.26 85.41,67.63 v85.41,47.62 v85.41,26.99 v85.41,6.67 85.41,1.91 85.09,1.59 v83.82,1.59
  Top 0.813: 46.04,88.27 v46.04,75.25 v46.04,70.17 v46.04,65.09 v46.04,60.01 v46.04,57.47 v46.04,53.66 v46.04,51.12 v46.04,47.31 v46.04,42.23 v46.04,37.15 v46.04,32.07 v46.04,25.72 | 46.04,88.27 46.04,90.04 C109.+ | 58.42,16.83 54.29,16.83 53.34,15.88 IC104.18 | 58.42,16.83 59.05,17.46 59.05,24.45 58.42,25.08 54.93,25.08 v54.29,25.72 | v20,17.46 20,9.84 24.77,5.08 v24.77,2.86 | 58.42,16.83 59.05,16.83 v59.05,1.59 | IC105.3 35.24,8.26 36.51,6.99 v36.51,2.86 | 46.04,88.27 45.72,87.95 IC103.3 36.2,87.95 35.56,88.58 C108.1 32.07,89.85 26.35,89.85 22.23,85.72 V101.OUT
  Bottom 0.406: RN202.8 v46.04,32.07 | RN202.6 v46.04,37.15 | RN202.4 v46.04,42.23 | RN202.2 v46.04,47.31 | IC101.30 v46.04,51.12 | RN201.8 v46.04,60.01 | RN201.6 v46.04,65.09 | RN201.4 v46.04,70.17 | RN201.2 v46.04,75.25
  Bottom 0.61: v83.82,1.59 v59.05,1.59 | IC101.10 v46.04,53.66 | R109.1 27.3,57.15 28.57,58.42 30.48,58.42 31.43,57.47 v46.04,57.47 | LED208.A v85.41,6.67 | LED207.A v85.41,26.99 | LED206.A v85.41,47.62
  Bottom 0.813: v59.05,1.59 50.48,1.59 | 50.48,1.59 48.26,1.59 46.99,2.86 v36.51,2.86 v24.77,2.86 | v54.29,25.72 v46.04,25.72 | SV101.2 26.99,16.83 26.35,17.46 v20,17.46 | IC102.8 IC102.7 | IC102.7 50.48,1.59 | IC102.3 47.94,11.11 50.48,8.57 IC102.7 | IC104.17 IC104.18
  pour Top: 6.35,94.61 10.48,94.61 14.92,99.06 52.39,99.06 54.29,97.16 54.29,81.6 52.7,80.01 52.39,79.69 48.26,79.69 46.35,77.79 27.62,77.79 25.08,80.33 11.11,80.33 7.3,84.14 4.13,84.14 3.17,85.09 3.17,93.34 4.45,94.61
+18V
  Top 0.813: D102.A 19.68,86.36 12.06,78.74 12.06,56.2 9.21,53.34 9.21,42.55 10.79,40.96 10.79,32.07 | 10.79,32.07 10.79,12.38 10.48,12.06 9.46,12.06 | X103.6 10.73,32 10.79,32.07
  Top 1.016: 9.46,12.06 X102.6
  Bottom 0.813: D102.A 22.86,87.95 28.26,93.34 D103.C | 39.37,93.03 D103.C | D103.C 39.05,92.71 R107.1
/CS-MBC  (via drill 0.3)
  Top 0.406: IC104.16 47.94,20.64 49.21,21.91 v49.21,26.67 | v41.27,26.99 v41.27,66.36 | IC101.5 33.02,66.36 30.8,68.58 R105.1
  Bottom 0.406: v49.21,26.67 48.9,26.99 v41.27,26.99 | v41.27,66.36 IC101.5
/CS-MEM  (via drill 0.3)
  Top 0.406: IC102.1 53.02,13.02 51.75,14.29 v51.75,29.53 | v42.23,29.53 v42.23,65.09 v42.23,71.44
  Bottom 0.406: v51.75,29.53 v42.23,29.53 | v42.23,71.44 IC101.38 | R104.1 31.11,65.72 31.75,65.09 v42.23,65.09
/RES  (via drill 0.3)
  Top 0.406: v36.51,8.89 v36.51,56.2 v36.51,60.01 v36.51,68.9 | R103.1 v29.84,60.01
  Bottom 0.406: SV101.5 25.72,8.89 v36.51,8.89 | v36.51,60.01 v29.84,60.01 C104.1 | IC101.9 v36.51,56.2 | IC101.37 v36.51,68.9
AREF
  Bottom 0.406: IC101.32 C101.1
CAN-H  (via drill 0.3)
  Top 0.406: v11.75,52.07 11.75,44.77 12.7,43.81 v12.7,33.97 v12.7,13.97
  Bottom 0.406: OK101.4 27.3,52.7 18.73,52.7 18.1,52.07 v11.75,52.07 | v12.7,33.97 9.46,33.97 X103.8 | X102.8 12.64,14.03 v12.7,13.97 12.7,8.57 13.34,7.94 37.47,7.94 37.78,7.62 IC105.7
CAN-L  (via drill 0.3)
  Top 0.406: v10.79,48.26 10.79,44.45 11.75,43.5 v11.75,35.56 v11.75,15.56 v11.75,6.99
  Bottom 0.406: X102.7 7.62,14.92 8.26,15.56 v11.75,15.56 | v10.79,48.26 R106.2 | X103.7 7.62,34.61 8.57,35.56 v11.75,35.56 | IC105.6 35.24,6.67 34.92,6.99 v11.75,6.99
G1  (via drill 0.3)
  Top 0.406: v59.69,78.11 59.69,64.45 60.64,63.5 v60.64,53.02 | v43.18,52.39 v43.18,33.34
  Bottom 0.406: OK202.2 v59.69,78.11 | v60.64,53.02 58.42,53.02 57.47,53.98 54.93,53.98 53.34,52.39 v43.18,52.39 | v43.18,33.34 IC101.23
G2  (via drill 0.3)
  Top 0.406: v45.09,56.2 v45.09,38.42
  Bottom 0.406: OK204.2 54.29,55.24 53.98,54.93 47.62,54.93 46.35,56.2 v45.09,56.2 | v45.09,38.42 IC101.25
G3  (via drill 0.3)
  Top 0.406: v62.55,42.55 v62.55,32.38
  Bottom 0.406: IC101.27 53.98,43.5 54.93,42.55 v62.55,42.55 | v62.55,32.38 OK206.2
G4  (via drill 0.3)
  Top 0.406: v60.64,46.67 60.64,35.24 61.59,34.29 61.59,27.62 62.23,26.99 62.23,15.24 61.59,14.61 v61.59,9.53
  Bottom 0.406: IC101.29 54.29,48.58 54.93,47.94 59.37,47.94 v60.64,46.67 | v61.59,9.53 OK208.2
GND  (via drill 0.3)
  Top 0.61: v22.54,55.56 C107.2 | IC101.11 32.07,51.12 31.75,51.44 v31.75,54.93 | LED201.K 90.49,78.42 91.12,77.79 v91.12,57.78 v91.12,37.15 v91.12,16.83 91.12,10.48 92.39,9.21 97.47,9.21 98.11,9.84 98.11,96.84 96.52,98.42 54.61,98.42 51.75,95.57 51.75,92.08 C109.-
  Top 0.813: V101.GND 24.77,82.23 26.35,80.64 26.35,62.55 25.4,61.59 C104.2 v25.4,55.56 v25.4,51.44 25.4,38.42 | 25.4,38.42 25.4,32.38 | 25.4,32.38 25.4,26.35 25.72,26.04 | C105.1 25.4,32.38 | 25.4,32.38 C106.1 | C102.1 25.4,38.42 | C103.1 25.4,38.42 | 7.62,29.84 7.62,30.16 | 7.62,30.16 X103.5 | X103.4 7.81,29.97 7.62,30.16 | 7.62,30.16 7.3,29.84 6.03,29.84 6.03,33.97 8.51,36.45 X103.S@1 8.57,38.65 8.57,40.01 5.3,43.28 X101.9 5.24,43.81 3.17,43.81 2.54,44.45 2.54,79.69 | X103.3 7.62,29.84 | 7.62,29.84 2.54,29.84 1.91,29.21 1.91,20.64 | 1.91,20.64 1.91,10.79 | 1.91,10.79 1.91,2.86 3.49,1.27 8.57,1.27 | 8.57,1.27 8.57,2.31 X102.S@2 | X102.4 8.64,9.97 X102.5 2.1,10.99 1.91,10.79 | X102.S@1 X103.S@2 8.51,20.7 8.57,20.64 1.91,20.64 | 40.32,1.27 IC105.8 40.32,8.57 37.78,11.11 IC105.2 | 40.32,1.27 26.99,1.27 | 26.99,1.27 15.24,1.27 | 15.24,1.27 8.57,1.27 | SV101.6 26.99,1.27 | IC104.9 28.26,23.5 25.72,26.04 | 25.72,26.04 15.88,26.04 15.24,25.4 15.24,1.27 | CON101.2 3.81,90.49 2.54,89.22 2.54,79.69 | D101.K 2.54,79.69 | IC102.4 45.4,9.53 46.67,8.26 46.67,1.91 46.04,1.27 40.32,1.27 | 51.75,92.2 C109.-
  Bottom 0.406: C101.2 IC101.31
  Bottom 0.61: IC101.31 47.62,53.66 46.35,54.93 v31.75,54.93 31.11,55.56 v22.54,55.56 | v91.12,16.83 LED204.K | LED203.K v91.12,37.15 | LED202.K v91.12,57.78
  Bottom 0.813: C107.2 C104.2 | OK101.2 v25.4,51.44 | C109.- 50.04,90.49 R108.2 43.81,90.17 43.81,88.58 38.1,82.87 IC103.1 34.92,82.87 34.61,83.19 C110.2 | C110.2 32.07,83.19 29.53,80.64 26.35,80.64 24.77,82.23 V101.GND | C108.2 C110.2
  pour Bottom: 6.03,94.61 10.48,94.61 15.24,99.38 52.07,99.38 54.29,97.16 54.29,81.6 52.39,79.69 47.94,79.69 46.04,77.79 27.94,77.79 25.4,80.33 11.11,80.33 7.3,84.14 4.45,84.14 3.17,85.41 3.17,93.34 4.45,94.61
GNDA
  Top 0.61: 75.56,45.09 T205.A1 T206.A1 | 75.56,45.09 R215.2 | R211.2 76.83,67.94 75.56,66.67 T203.A1 75.56,59.05 R213.2 77.47,56.52 75.56,54.61 T204.A1 75.56,45.09 | T202.A1 71.75,80.64 R209.2 74.3,86.68 77.15,89.53 R207.2 75.56,92.39 T201.A1 | T207.A1 72.39,23.5 R222.2 75.88,26.04 R220.2 78.11,31.43 C206.2 82.23,32.38 82.23,19.37 | T208.A1 75.56,9.21 77.15,10.79 R224.2 | C202.2 81.28,75.25 81.92,74.61 81.92,67.94 81.28,67.31 C203.2
  Top 0.813: X201.1 85.72,93.66 83.82,91.76 83.82,89.53 | 83.82,89.53 83.82,19.37 | 83.82,19.37 82.23,19.37 C207.2 | C208.2 82.87,10.79 83.82,11.75 83.82,19.37 | C201.2 83.5,89.22 83.82,89.53
  Bottom 0.61: T206.A1 79.38,32.7 C206.2 | R215.2 80.33,45.09 C205.2 | R213.2 80.33,56.52 C204.2 | R211.2 78.74,67.94 79.38,67.31 C203.2 | R207.2 80.33,89.53 C201.2 | R224.2 C208.2
K11
  Top 0.61: R206.2 66.04,95.89 66.67,96.52 72.39,96.52 73.03,95.89 T201.A2
  Bottom 0.61: X202.1 94.93,81.6 92.08,84.45 68.9,84.45 68.26,85.09 R201.1 71.12,86.68 73.03,88.58 T201.A2
K13
  Top 0.61: R208.2 66.36,83.82 67.31,82.87 67.31,79.06 68.26,78.11 T202.A2
  Bottom 0.61: T202.A2 72.07,78.11 R202.1 87.31,83.19 90.81,79.69 90.81,69.85 92.39,68.26 X202.3
K21
  Top 0.61: R210.2 67.31,72.39 67.94,71.75 R203.1 72.39,70.8 73.03,70.17 T203.A2
  Bottom 0.61: X203.1 94.93,60.96 93.66,62.23 79.06,62.23 78.11,61.28 73.66,61.28 73.03,61.91 T203.A2
K23
  Top 0.61: R212.2 66.36,60.96 R204.1 69.53,59.37 73.03,55.88 T204.A2
  Bottom 0.61: X203.3 93.66,47.62 90.49,50.8 77.79,50.8 76.83,49.85 73.98,49.85 73.03,50.8 T204.A2
K31
  Top 0.61: R214.2 66.36,49.53 R205.1 71.75,47.94 73.03,46.67 T205.A2
  Bottom 0.61: X204.1 94.93,39.37 93.98,40.32 80.01,40.32 78.42,38.73 74.3,38.73 73.03,40.01 T205.A2
K33
  Top 0.61: R219.2 66.36,38.1 R216.1 71.44,36.51 73.03,34.92 T206.A2
  Bottom 0.61: X204.3 94.93,29.21 94.3,29.84 73.66,29.84 73.03,30.48 T206.A2
K41
  Top 0.61: R221.2 66.67,26.67 67.31,26.04 67.31,22.23 68.58,20.95 T207.A2
  Bottom 0.61: X205.1 94.93,20 93.34,21.59 85.09,21.59 80.64,26.04 R217.1 76.83,26.04 71.75,20.95 T207.A2
K43
  Top 0.61: T208.A2 73.03,12.06 71.44,13.65 R218.1 66.36,15.24 R223.2
  Bottom 0.61: X205.3 93.34,6.67 90.17,9.84 82.23,9.84 81.6,9.21 73.03,9.21 T208.A2
LED-G
  Bottom 0.406: R102.1 32.7,74.3 33.02,73.98 IC101.2
LED-R
  Top 0.406: R101.1 30.16,71.44 32.7,68.9 IC101.4
MISO  (via drill 0.3)
  Top 0.406: IC104.15 v45.4,17.78 45.4,20.32 v44.13,21.59 v44.13,34.61 | v40.32,34.61 v40.32,61.28 | IC102.2 50.48,13.02 49.21,14.29 v49.21,17.78 | SV101.1 24.45,18.1 v27.94,21.59
  Bottom 0.406: v44.13,34.61 v40.32,34.61 | v40.32,61.28 IC101.7 | v49.21,17.78 v45.4,17.78 | v27.94,21.59 v44.13,21.59
MOSI  (via drill 0.3)
  Top 0.406: v39.37,63.82 39.37,34.29 40.32,33.34 40.32,26.67 41.59,25.4 41.59,21.91 42.86,20.64 IC104.14 v42.86,10.79 45.4,8.26 IC102.5
  Bottom 0.406: v39.37,63.82 IC101.6 | SV101.4 29.21,12.7 31.43,10.79 v42.86,10.79
N$1  (via drill 0.3)
  Top 0.406: IC104.1 v53.02,20.64 | v39.05,20.64 39.05,14.61 40.32,13.34 IC105.1
  Bottom 0.406: v53.02,20.64 v39.05,20.64
N$2  (via drill 0.3)
  Top 0.406: IC105.4 32.7,13.02 31.43,14.29 v31.43,19.68 | v50.48,19.68 IC104.2
  Bottom 0.406: v31.43,19.68 v50.48,19.68
N$3
  Top 0.406: R106.1 29.84,50.16 OK101.3
N$4  (via drill 0.3)
  Top 0.406: R109.2 29.84,56.2 29.21,55.56 28.26,55.56 v26.67,53.98 | v12.7,53.34 12.7,45.09 13.65,44.13 v13.65,5.08
  Bottom 0.406: v26.67,53.98 OK101.1 18.73,53.98 18.1,53.34 v12.7,53.34 | v13.65,5.08 7.3,5.08 6.03,6.35 6.03,8.26 6.67,8.89 7.56,8.89 X102.3
N$5  (via drill 0.3)
  Top 0.406: v58.74,45.09 v58.74,34.92
  Bottom 0.406: RN202.3 53.98,44.77 54.29,45.09 v58.74,45.09 | v58.74,34.92 OK206.1
N$6
  Top 0.813: D102.C 29.84,83.82 | 29.84,83.82 29.84,80.96 30.16,80.64 C110.1 | V101.IN 29.84,83.82
  Bottom 0.813: C110.1 38.1,80.64 40.96,83.5 C111.+
N$7  (via drill 0.3)
  Top 0.406: v59.69,79.38 v59.69,92.08
  Bottom 0.406: RN201.1 52.7,77.79 54.29,79.38 v59.69,79.38 | v59.69,92.08 OK201.1
N$8
  Top 0.61: OK206.4 66.36,29.84 R220.1 70.48,30.8 T206.G
N$9  (via drill 0.3)
  Top 0.406: v8.26,71.44 v8.26,77.15
  Bottom 0.406: R101.2 v8.26,71.44 | v8.26,77.15 D101.AR
N$10
  Top 0.61: T201.G 70.48,90.49 69.53,89.53 R207.1 65.72,87 OK201.4
N$11
  Bottom 0.406: R206.1 60.33,95.25 63.5,92.08 OK201.6
N$12  (via drill 0.3)
  Top 0.406: v58.74,73.66 v58.74,80.64
  Bottom 0.406: RN201.3 53.34,72.71 54.29,73.66 v58.74,73.66 | v58.74,80.64 OK202.1
N$13  (via drill 0.3)
  Top 0.406: v9.21,74.3 v9.21,82.23
  Bottom 0.406: R102.2 v9.21,74.3 | v9.21,82.23 D101.AG
N$14
  Bottom 0.406: R219.1 60.01,38.1 63.18,34.92 OK206.6
N$15
  Bottom 0.61: R201.2 C201.1
N$16
  Bottom 0.61: R216.2 C206.1
N$17
  Top 0.61: OK202.4 T202.G 71.75,75.56 R209.1
N$18
  Bottom 0.406: R208.1 60.33,83.82 63.5,80.64 OK202.6
N$19  (via drill 0.3)
  Top 0.406: v59.69,39.69 59.69,26.67 60.33,26.04 v60.33,23.5
  Bottom 0.406: RN202.5 v59.69,39.69 | v60.33,23.5 OK207.1
N$20
  Bottom 0.61: R202.2 78.74,73.03 79.06,72.71 C202.1
N$21
  Bottom 0.406: RN201.5 53.98,67.63 55.56,69.22 OK203.1
N$22
  Top 0.61: OK207.4 T207.G 73.34,18.41 74.93,16.83 R222.1
N$23
  Top 0.61: OK203.4 67.94,64.14 | 67.94,64.14 T203.G | R211.1 67.94,64.14
N$24
  Bottom 0.406: R210.1 60.01,72.39 63.18,69.22 OK203.6
N$25
  Bottom 0.406: R221.1 59.37,26.67 62.55,23.5 OK207.6
N$26
  Bottom 0.61: R203.2 79.06,70.8 80.01,69.85 C203.1
N$27
  Top 0.406: RN201.7 53.34,62.55 54.29,61.59 54.29,59.37 55.88,57.78 OK204.1
N$28
  Bottom 0.61: R217.2 79.69,15.88 C207.1
N$29
  Top 0.61: OK204.4 67.94,52.7 | 67.94,52.7 T204.G | R213.1 67.94,52.7
N$30
  Bottom 0.406: R212.1 59.69,60.96 62.87,57.78 OK204.6
N$31  (via drill 0.3)
  Top 0.406: v60.64,33.66 60.64,27.3 61.28,26.67 61.28,15.56 60.64,14.92 v60.64,12.06
  Bottom 0.406: RN202.7 53.34,34.61 54.29,33.66 v60.64,33.66 | v60.64,12.06 OK208.1
N$32
  Bottom 0.61: R204.2 C204.1
N$33
  Top 0.406: RN202.1 53.02,49.85 56.52,46.35 OK205.1
N$34
  Top 0.61: R224.1 67.94,7.62 | 67.94,7.62 68.58,6.99 T208.G | OK208.4 67.31,6.99 67.94,7.62
N$35
  Top 0.61: OK205.4 67.94,41.27 | 67.94,41.27 T205.G | R215.1 67.94,41.27
N$36
  Bottom 0.406: R214.1 59.37,49.53 62.55,46.35 OK205.6
N$37
  Bottom 0.406: R223.1 59.69,15.24 62.87,12.06 OK208.6
N$38
  Bottom 0.61: R205.2 C205.1
N$39
  Bottom 0.61: R218.2 80.33,13.65 C208.1
N$40  (via drill 0.3)
  Top 0.406: C102.2 20.95,41.27 22.35,42.67 Q101.2 22.35,46.48 v22.54,46.67
  Bottom 0.406: v22.54,46.67 30.16,46.67 32.07,48.58 IC101.12
N$41  (via drill 0.3)
  Top 0.406: C103.2 28.57,41.27 27.18,42.67 Q101.1 27.3,43.31 v27.3,45.72
  Bottom 0.406: IC101.13 27.62,46.04 v27.3,45.72
N$42
  Top 0.406: Q102.2 22.35,29.72 20.95,31.11 C105.2
  Bottom 0.406: IC104.8 35.24,25.4 34.61,26.04 23.18,26.04 22.23,26.99 22.23,27.5 Q102.2
N$43
  Top 0.406: Q102.1 27.18,29.4 28.57,30.8 C106.2
  Bottom 0.406: IC104.7 37.78,26.35 37.47,26.67 28.13,26.67 Q102.1
O1
  Top 0.406: LED201.A 86.68,73.66 89.22,71.12 LED205.K
  Bottom 0.406: IC101.36 53.66,66.36 55.24,67.94 66.36,67.94 67.63,69.22 74.93,69.22 78.42,65.72 87.31,65.72 89.22,67.63 LED205.K
O2
  Top 0.406: LED202.A 86.68,53.34 89.22,50.8 LED206.K
  Bottom 0.406: IC101.35 53.66,63.82 55.24,65.41 60.96,65.41 63.5,62.87 69.22,62.87 77.15,54.93 83.82,54.93 LED202.A
O3  (via drill 0.3)
  Top 0.406: v59.69,62.55 v59.69,40.96 | LED203.A 86.68,33.66 89.22,31.11 LED207.K
  Bottom 0.406: IC101.34 53.66,61.28 54.93,62.55 v59.69,62.55 | v59.69,40.96 62.23,40.96 63.5,39.69 68.26,39.69 69.85,38.1 73.66,38.1 73.98,37.78 86.04,37.78 LED203.A
O4  (via drill 0.3)
  Top 0.406: v61.59,39.05 v61.59,57.47 | LED204.A 86.68,12.7 89.22,10.16 LED208.K | v63.18,16.83 v63.18,28.57
  Bottom 0.406: v61.59,57.47 60.01,59.05 54.61,59.05 53.98,58.42 49.21,58.42 IC101.33 | LED204.A 84.45,16.83 83.19,18.1 73.66,18.1 72.39,16.83 v63.18,16.83 | v61.59,39.05 61.59,38.42 63.18,36.83 66.04,36.83 67.63,35.24 67.63,29.53 66.67,28.57 v63.18,28.57
P10  (via drill 0.3)
  Top 0.406: v37.47,70.17 v37.47,43.5
  Bottom 0.406: X101.1 6.03,71.76 7.3,70.48 17.14,70.48 17.46,70.17 v37.47,70.17 | v37.47,43.5 IC101.14
P11  (via drill 0.3)
  Top 0.406: v35.56,67.63 35.56,41.27 35.24,40.96 IC101.15
  Bottom 0.406: X101.2 17.47,68.26 18.41,67.31 31.43,67.31 31.75,67.63 v35.56,67.63
P12  (via drill 0.3)
  Top 0.406: v14.61,40.01 14.61,44.45 13.65,45.4 v13.65,64.77
  Bottom 0.406: IC101.16 31.75,38.42 30.16,40.01 v14.61,40.01 | v13.65,64.77 X101.3
P13  (via drill 0.3)
  Top 0.406: v15.56,35.88 15.56,44.77 14.61,45.72 v14.61,61.28
  Bottom 0.406: IC101.17 v15.56,35.88 | v14.61,61.28 5.32,61.28 X101.4
P14  (via drill 0.3)
  Top 0.406: v17.46,34.29 17.46,45.4 16.51,46.35 v16.51,57.78
  Bottom 0.406: IC101.18 32.07,33.34 31.11,34.29 v17.46,34.29 | v16.51,57.78 5.33,57.78 X101.5
P15  (via drill 0.3)
  Top 0.406: v18.41,30.8 18.41,45.72 17.46,46.67 v17.46,54.29
  Bottom 0.406: IC101.19 v18.41,30.8 | v17.46,54.29 5.33,54.29 X101.6
P16  (via drill 0.3)
  Top 0.406: v19.37,28.89 19.37,46.04 18.41,46.99 v18.41,50.8
  Bottom 0.406: IC101.20 30.48,28.26 29.84,28.89 v19.37,28.89 | v18.41,50.8 5.34,50.8 X101.7
P17  (via drill 0.3)
  Top 0.406: v16.51,29.84 16.51,45.09 15.56,46.04 v15.56,47.31
  Bottom 0.406: IC101.21 36.83,28.26 35.56,29.53 31.11,29.53 30.8,29.84 v16.51,29.84 | v15.56,47.31 5.35,47.31 X101.8
PLUGGED  (via drill 0.3)
  Top 0.406: v10.16,72.71 10.16,85 CON101.3
  Bottom 0.406: IC101.39 36.83,73.98 35.56,72.71 v10.16,72.71
R1  (via drill 0.3)
  Top 0.406: v63.5,31.11 63.5,89.22 v63.18,89.53
  Bottom 0.406: IC101.22 54.29,30.8 54.61,31.11 v63.5,31.11 | v63.18,89.53 OK201.2
R2  (via drill 0.3)
  Top 0.406: v62.55,65.09 v62.55,51.12 | v44.13,49.85 v44.13,35.88
  Bottom 0.406: OK203.2 60.96,66.67 v62.55,65.09 | v62.55,51.12 51.44,51.12 50.16,49.85 v44.13,49.85 | v44.13,35.88 IC101.24
R3
  Top 0.406: IC101.26 53.66,40.96 56.52,43.81 OK205.2
R4  (via drill 0.3)
  Top 0.406: v46.99,46.04 46.99,25.08 46.67,24.77 v46.67,21.59
  Bottom 0.406: IC101.28 v46.99,46.04 | v46.67,21.59 54.29,21.59 54.93,20.95 OK207.2
SCK  (via drill 0.3)
  Top 0.406: IC104.13 v40.32,18.73 40.32,20.64 39.05,21.91 39.05,33.34 38.42,33.97 v38.42,58.74 | IC102.6 47.94,8.89 v46.99,9.84 46.67,10.16 v46.67,18.73
  Bottom 0.406: v38.42,58.74 IC101.8 | v46.67,18.73 v40.32,18.73 | SV101.3 25.72,11.43 29.21,11.43 30.8,9.84 v46.99,9.84
SPG
  Bottom 0.406: R107.2 R108.1 44.13,77.47 45.09,76.52 IC101.40
V+
  Top 0.813: X201.2 93.03,88.58 92.39,87.95 92.39,73.66 | 92.39,73.66 92.39,53.02 | 92.39,53.02 92.39,32.07 | 92.39,32.07 92.39,12.06 92.71,11.75 X205.2 | X204.2 92.39,32.07 | X203.2 92.71,52.7 92.39,53.02 | X202.2 92.71,73.34 92.39,73.66
V-NETZTEIL1
  Bottom 0.813: CON101.1 18.41,90.49 21.27,93.34 D103.A

### Text on the board
Bottom: bottom | MBCAN-Projekt | 20.07.2024 | (c) Dr.-Ing. Th. Wiesner | mbc92.brd
tNames: HW: 24.07.20 | AC | 0 | L | +18V | +18V | DC | Status | (c) Dr.-Ing. Th. Wiesner | MBCAN-Projekt | CH1 | CH2 | IN | CH3 | OUT | CH4 | mbc-92
bNames: 26.10.2019